# Altium schematic sheet Sensor_Sheet.SchDoc
size A4; DocumentNumber: 3; SheetNumber: 3; SheetTotal: 7
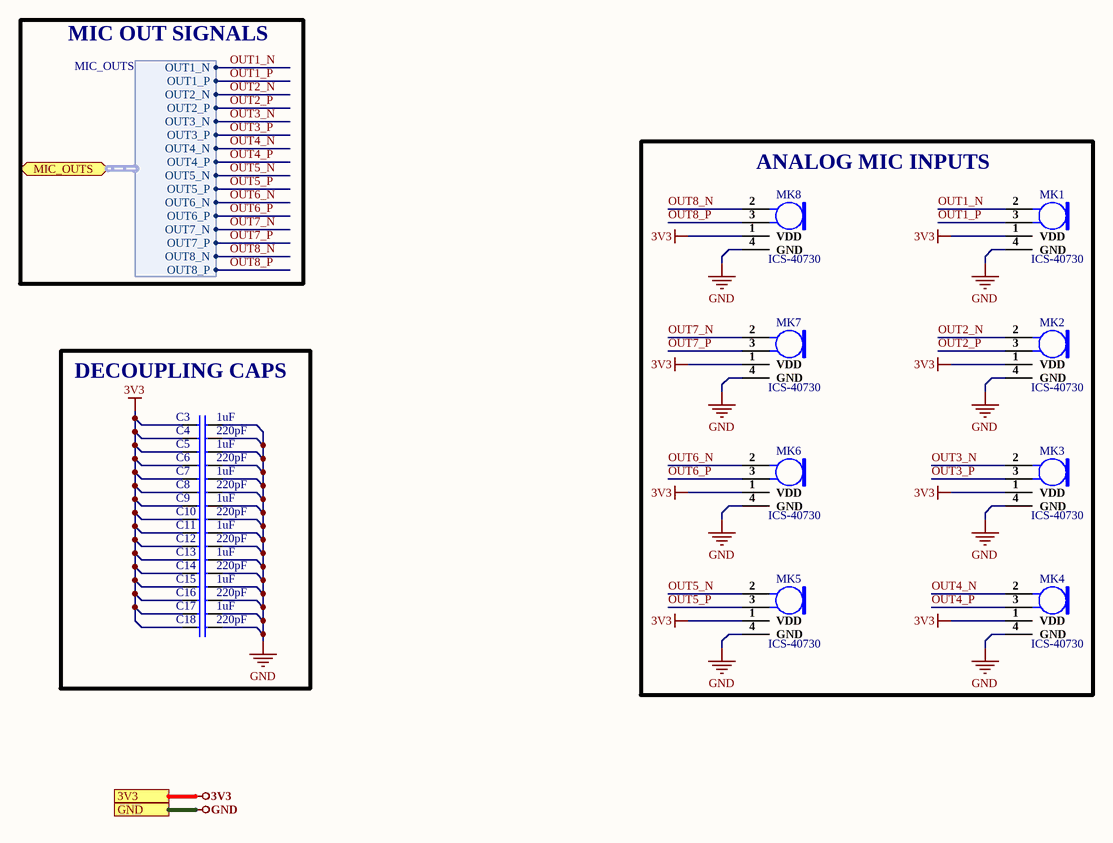
[diagram p0: Sensor_Sheet.SchDoc]

## Parts
C3  1uF  [Cap 0603]
C4  220pF  [Cap 0402]
C5  1uF  [Cap 0603]
C6  220pF  [Cap 0402]
C7  1uF  [Cap 0603]
C8  220pF  [Cap 0402]
C9  1uF  [Cap 0603]
C10  220pF  [Cap 0402]
C11  1uF  [Cap 0603]
C12  220pF  [Cap 0402]
C13  1uF  [Cap 0603]
C14  220pF  [Cap 0402]
C15  1uF  [Cap 0603]
C16  220pF  [Cap 0402]
C17  1uF  [Cap 0603]
C18  220pF  [Cap 0402]
MK1  ICS-40730  [ICS-40730]
MK2  ICS-40730  [ICS-40730]
MK3  ICS-40730  [ICS-40730]
MK4  ICS-40730  [ICS-40730]
MK5  ICS-40730  [ICS-40730]
MK6  ICS-40730  [ICS-40730]
MK7  ICS-40730  [ICS-40730]
MK8  ICS-40730  [ICS-40730]

## Blocks framed on the sheet
ANALOG MIC INPUTS: MK1-MK8
DECOUPLING CAPS: C3-C18

## Ports
3V3, GND, MIC_OUTS (bidir, harness MIC_OUTS)

## Harnesses
MIC_OUTS: OUT1_N, OUT1_P, OUT2_N, OUT2_P, OUT3_N, OUT3_P, OUT4_N, OUT4_P, OUT5_N, OUT5_P, OUT6_N, OUT6_P, OUT7_N, OUT7_P, OUT8_N, OUT8_P

## Nets
3V3: C3.1 C4.1 C5.1 C6.1 C7.1 C8.1 C9.1 C10.1 C11.1 C12.1 C13.1 C14.1 C15.1 C16.1 C17.1 C18.1 MK1.1(VDD) MK2.1(VDD) MK3.1(VDD) MK4.1(VDD) MK5.1(VDD) MK6.1(VDD) MK7.1(VDD) MK8.1(VDD) ; port 3V3
GND: C3.2 C4.2 C5.2 C6.2 C7.2 C8.2 C9.2 C10.2 C11.2 C12.2 C13.2 C14.2 C15.2 C16.2 C17.2 C18.2 MK1.4(GND) MK2.4(GND) MK3.4(GND) MK4.4(GND) MK5.4(GND) MK6.4(GND) MK7.4(GND) MK8.4(GND) ; port GND
OUT1_N: MK1.2(OUTPUT+) ; port MIC_OUTS.OUT1_N
OUT1_P: MK1.3(OUTPUT-) ; port MIC_OUTS.OUT1_P
OUT2_N: MK2.2(OUTPUT+) ; port MIC_OUTS.OUT2_N
OUT2_P: MK2.3(OUTPUT-) ; port MIC_OUTS.OUT2_P
OUT3_N: MK3.2(OUTPUT+) ; port MIC_OUTS.OUT3_N
OUT3_P: MK3.3(OUTPUT-) ; port MIC_OUTS.OUT3_P
OUT4_N: MK4.2(OUTPUT+) ; port MIC_OUTS.OUT4_N
OUT4_P: MK4.3(OUTPUT-) ; port MIC_OUTS.OUT4_P
OUT5_N: MK5.2(OUTPUT+) ; port MIC_OUTS.OUT5_N
OUT5_P: MK5.3(OUTPUT-) ; port MIC_OUTS.OUT5_P
OUT6_N: MK6.2(OUTPUT+) ; port MIC_OUTS.OUT6_N
OUT6_P: MK6.3(OUTPUT-) ; port MIC_OUTS.OUT6_P
OUT7_N: MK7.2(OUTPUT+) ; port MIC_OUTS.OUT7_N
OUT7_P: MK7.3(OUTPUT-) ; port MIC_OUTS.OUT7_P
OUT8_N: MK8.2(OUTPUT+) ; port MIC_OUTS.OUT8_N
OUT8_P: MK8.3(OUTPUT-) ; port MIC_OUTS.OUT8_P

## Notes on the sheet
- MIC OUT SIGNALS
- 1
- Huzaifa Ali

## Library data of the parts
C3 C5 C7 C9 C11 C13 C15 C17 = CC0603KRX5R8BB105: CAP CER 1UF 25V X5R 0603; Manufacturer: Yageo; Tolerance: 10%; Supplier 1: Digi-Key; Manufacturer Part Number: CC0603KRX5R8BB105; RoHS: Yes; Category: Ceramic Capacitors; Stock 1: 919939; Pricing 1: 1=0.12000, 10=0.08400, 50=0.04760, 100=0.03940, 500=0.02764, 1000=0.02288 (USD); Mount: Surface Mount; Case/Package: 0603; Number of Pins: 2; Case Code (Metric): 1608; Case Code (Imperial): 0603; Min Operating Temperature: -55°C; Max Operating Temperature: 85°C; Capacitance: 1uF; Dielectric: X5R; Package Quantity: 1; Voltage Rating: 25V; Packaging: Tape and Reel; Termination: SMD/SMT; Voltage Rating (DC): 25V; Series: CC; Construction: Flat; Length: 1.6mm; Width: 0.031inch; Height: 0.8mm; Thickness: 0.035inch; Depth: 0.8mm; Radiation Hardening: No; REACH SVHC: No SVHC; Lead Free: Lead Free; Halogen Free: Halogen Free; RoHS Compliant: Yes; ComponentLink1URL: https://datasheet.ciiva.com/176/mlccorderingcode-176785.pdf?src-supplier=Digi-Key; ComponentLink1Description: https://datasheet.ciiva.com/176/mlccorderingcode-176785.pdf?src-supplier=Digi-Key; ComponentLink2URL: https://datasheet.ciiva.com/176/mlccorderingcode-176786.pdf?src-supplier=Digi-Key; ComponentLink2Description: https://datasheet.ciiva.com/176/mlccorderingcode-176786.pdf?src-supplier=Digi-Key; ComponentLink3URL: https://datasheet.ciiva.com/176/mlccorderingcode-176787.pdf?src-supplier=Digi-Key; ComponentLink3Description: https://datasheet.ciiva.com/176/mlccorderingcode-176787.pdf?src-supplier=Digi-Key; ComponentLink4URL: https://datasheet.ciiva.com/17436/upy-gphc-x5r-4v-to-50v-12-17436952.pdf?src-supplier=Avnet+Europe; ComponentLink4Description: https://datasheet.ciiva.com/17436/upy-gphc-x5r-4v-to-50v-12-17436952.pdf?src-supplier=Avnet+Europe; ComponentLink5URL: https://datasheet.ciiva.com/7978/1525783-7978171.pdf?src-supplier=Element14; ComponentLink5Description: https://datasheet.ciiva.com/7978/1525783-7978171.pdf?src-supplier=Element14; ComponentLink6URL: https://datasheet.ciiva.com/11586/upy-gphc-x5r-4v-to-50v-12-11586318.pdf?src-supplier=Avnet; ComponentLink6Description: https://datasheet.ciiva.com/11586/upy-gphc-x5r-4v-to-50v-12-11586318.pdf?src-supplier=Avnet; Supplier Part Number 1: 311-1445-1-ND
C4 C6 C8 C10 C12 C14 C16 C18 = CC0402JRNPO9BN221: CAP CER 220PF 50V C0G/NPO 0402; Manufacturer: Yageo; Dielectric Material: Ceramic; Tolerance: 10%; Dielectric: C0G; Temperature Coefficient: 30ppm/°C; Insulation Resistance: 10GR; Dissipation Factor: 0.1%; Supplier 1: RSComponents; Manufacturer Part Number: CC0402JRNPO9BN221; RoHS: Yes; Category: Ceramic Capacitors; Stock 1: 20000; Pricing 1: 10000=0.00600, 100000=0.00600 (GBP); Mount: Surface Mount; Case/Package: 0402; Number of Pins: 2; Case Code (Metric): 1005; Case Code (Imperial): 0402; Min Operating Temperature: -55°C; Max Operating Temperature: 125°C; Capacitance: 220pF; Package Quantity: 1; Voltage Rating: 50V; Packaging: Tape and Reel; Termination: SMD/SMT; Voltage: 50V; Series: CC; Length: 1mm; Width: 0.02inch; Height: 0.5mm; Thickness: 0.022inch; Depth: 0.5mm; Radiation Hardening: No; RoHS Compliant: Yes; REACH SVHC: No SVHC; Lead Free: Lead Free; ComponentLink1URL: https://datasheet.ciiva.com/11786/0900766b8079c870-11786154.pdf?src-supplier=RSComponents; ComponentLink1Description: https://datasheet.ciiva.com/11786/0900766b8079c870-11786154.pdf?src-supplier=RSComponents; ComponentLink2URL: https://datasheet.ciiva.com/7656/1132289-7656616.pdf?src-supplier=Element14; ComponentLink2Description: https://datasheet.ciiva.com/7656/1132289-7656616.pdf?src-supplier=Element14; ComponentLink3URL: https://datasheet.ciiva.com/8033/1443161-8033609.pdf?src-supplier=Element14; ComponentLink3Description: https://datasheet.ciiva.com/8033/1443161-8033609.pdf?src-supplier=Element14; ComponentLink4URL: https://datasheet.ciiva.com/8033/1443161-8033608.pdf?src-supplier=Element14; ComponentLink4Description: https://datasheet.ciiva.com/8033/1443161-8033608.pdf?src-supplier=Element14; ComponentLink5URL: https://datasheet.ciiva.com/176/mlccorderingcode-176384.pdf?src-supplier=Digi-Key; ComponentLink5Description: https://datasheet.ciiva.com/176/mlccorderingcode-176384.pdf?src-supplier=Digi-Key; ComponentLink6URL: https://datasheet.ciiva.com/176/mlccorderingcode-176383.pdf?src-supplier=Digi-Key; ComponentLink6Description: https://datasheet.ciiva.com/176/mlccorderingcode-176383.pdf?src-supplier=Digi-Key; ComponentLink7URL: https://datasheet.ciiva.com/176/mlccorderingcode-176385.pdf?src-supplier=Digi-Key; ComponentLink7Description: https://datasheet.ciiva.com/176/mlccorderingcode-176385.pdf?src-supplier=Digi-Key; ComponentLink8URL: https://datasheet.ciiva.com/17434/upy-gp-np0-16v-to-50v-8-17434343.pdf?src-supplier=Avnet+Europe; ComponentLink8Description: https://datasheet.ciiva.com/17434/upy-gp-np0-16v-to-50v-8-17434343.pdf?src-supplier=Avnet+Europe; Supplier Part Number 1: 6169284
MK1-MK8 = ICS-40730: MICROPHONE MEMS ANALOG NC -32DB; Manufacturer: TDK InvenSense; Shape: Rectangular; Impedance: 750R; Operating Supply Current: 285uA; Supplier 1: Newark; Manufacturer Part Number: ICS-40730; RoHS: No; Stock 1: 51; Pricing 1: 1=3.61000, 10=2.99000, 25=2.76000, 50=2.59000, 100=2.43000 (USD); Output Type: Analog; Packaging: Cut Tape; Termination: Solder; RoHS Compliant: No; ComponentLink1URL: https://www.invensense.com/wp-content/uploads/2017/01/ICS-40730-Datasheet.pdf?src-supplier=Digi-Key; ComponentLink1Description: https://www.invensense.com/wp-content/uploads/2017/01/ICS-40730-Datasheet.pdf?src-supplier=Digi-Key; ComponentLink2URL: http://www.invensense.com/wp-content/uploads/2018/12/DS-000139-ICS-40730-v1.0.pdf?src-supplier=Digi-Key; ComponentLink2Description: http://www.invensense.com/wp-content/uploads/2018/12/DS-000139-ICS-40730-v1.0.pdf?src-supplier=Digi-Key; Supplier Part Number 1: 69AC5942